# Altium project Battery bank.PrjPcb (part 1 of 2)
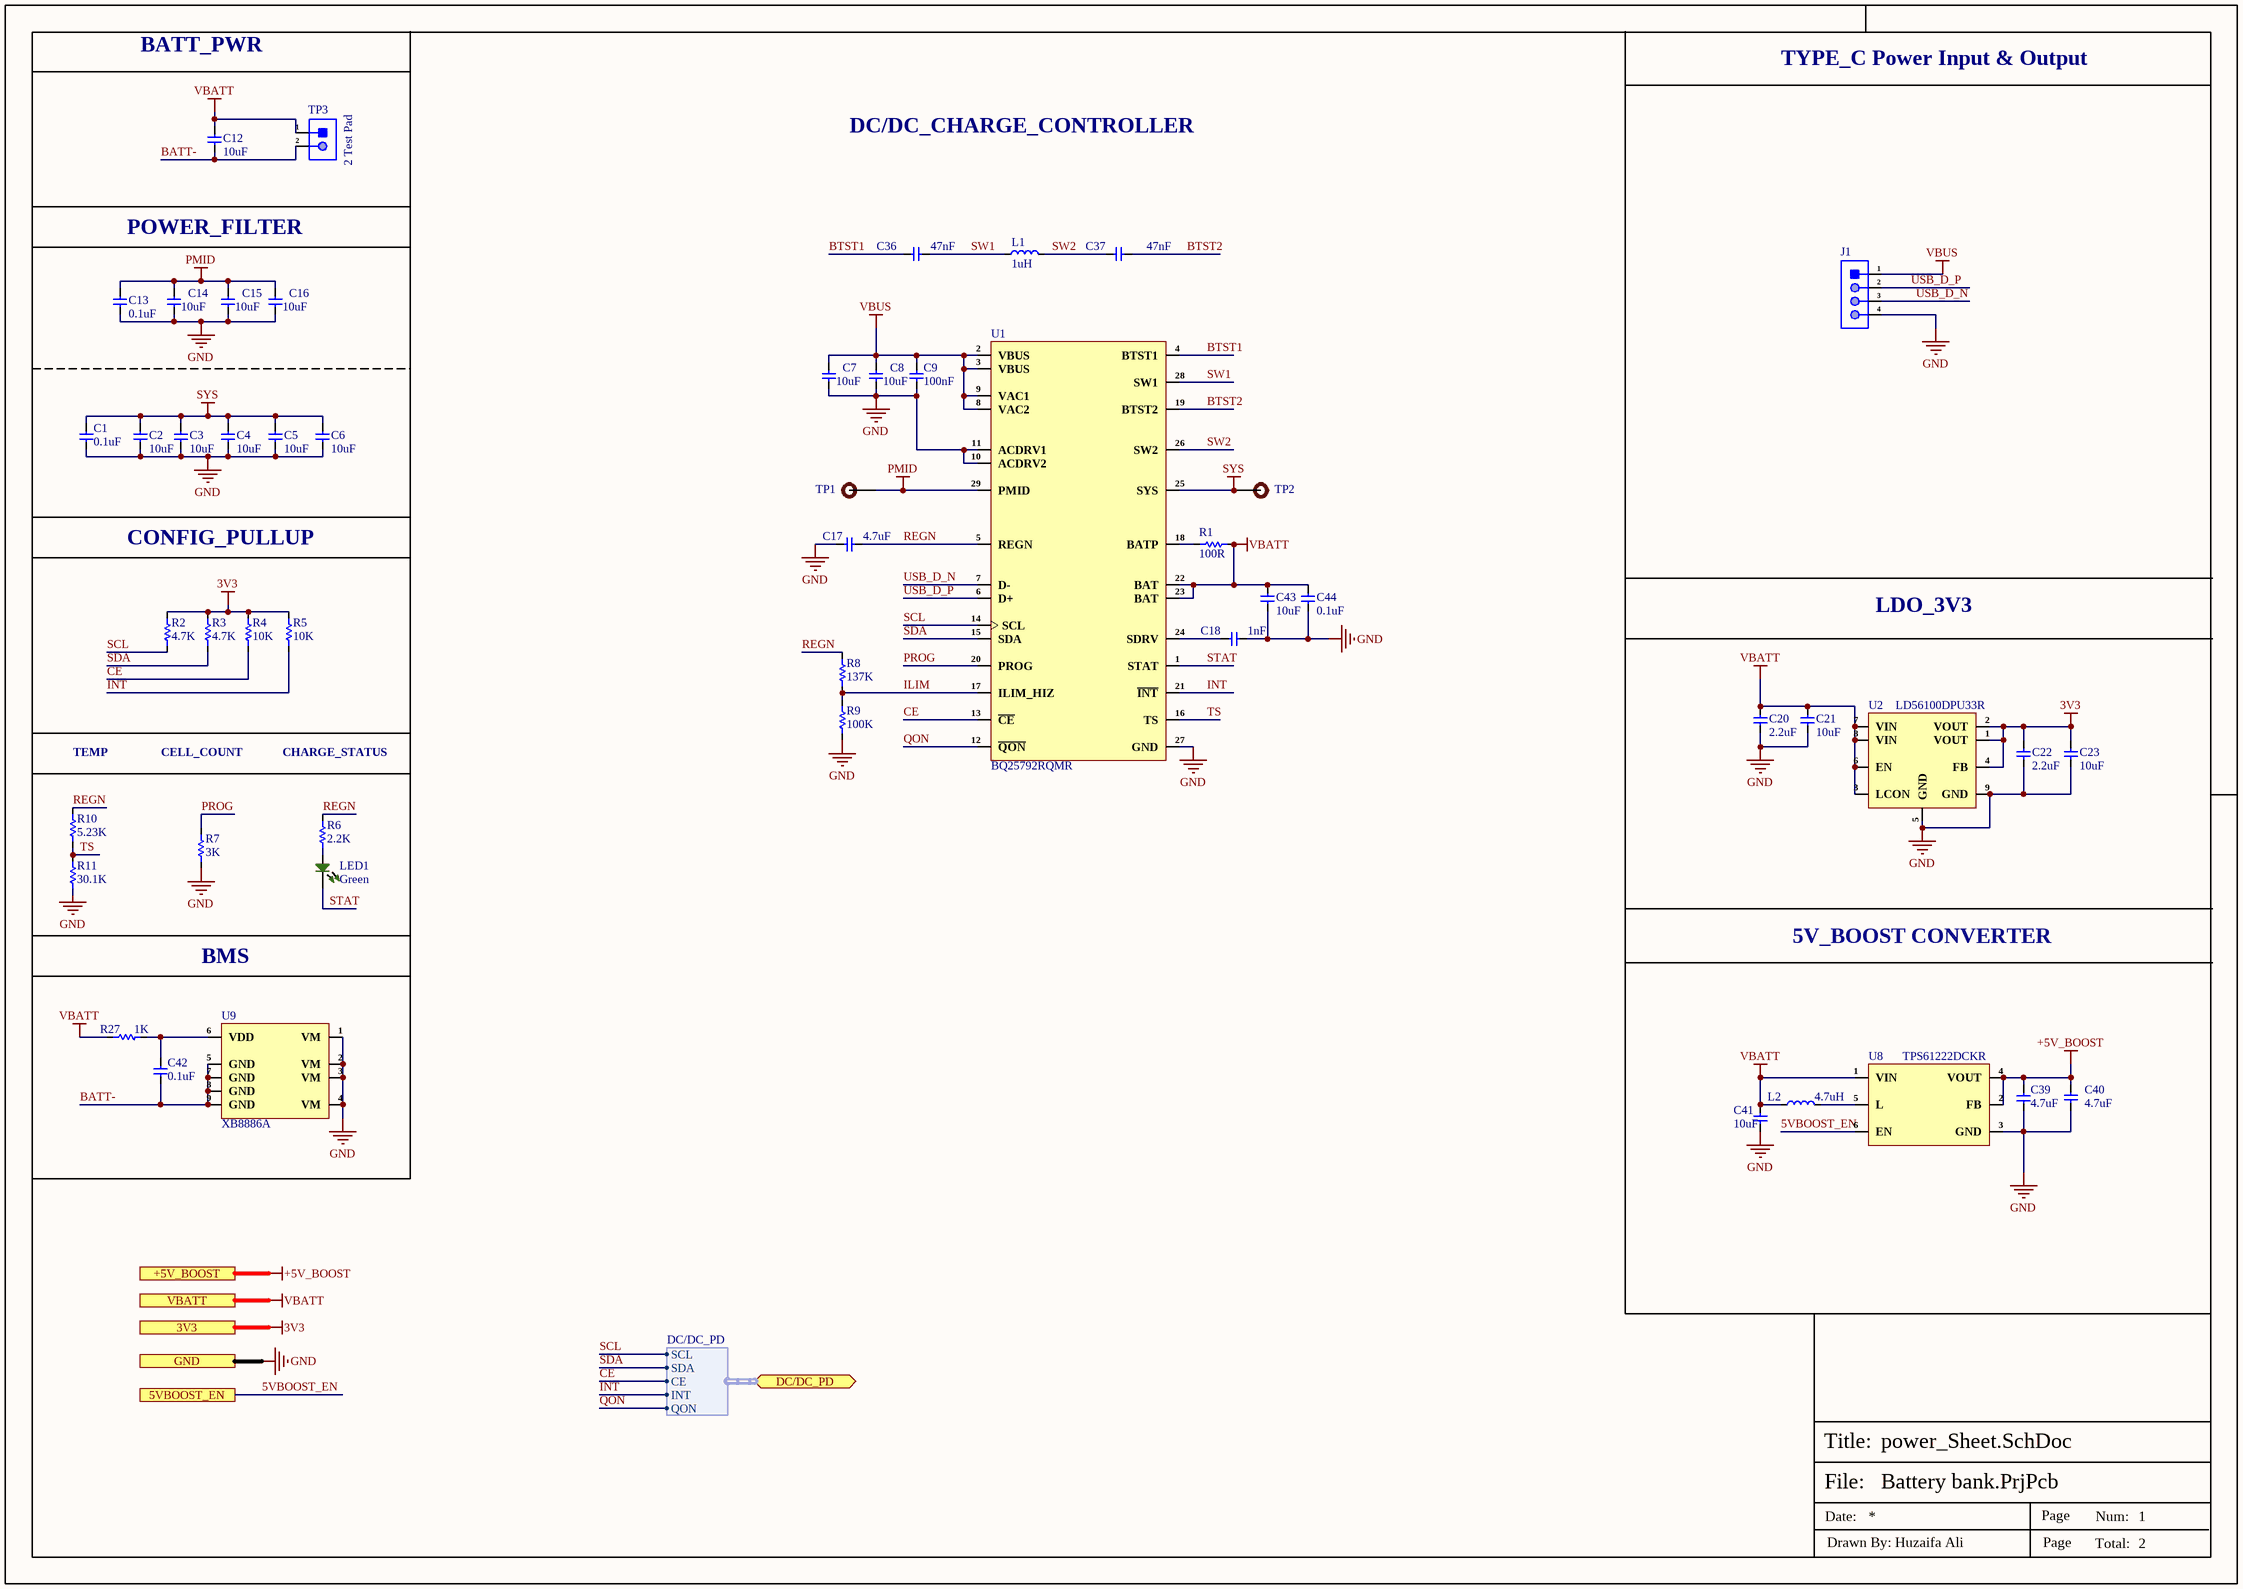
[diagram p0: power_Sheet.SchDoc]
2 sheets, 96 parts. Net scope: flat (ports and power ports of the same name join across sheets).
Board file: Battery Bank_PCB.PcbDoc
Sheets:
  power_Sheet.SchDoc
  Controller_Sheet.SchDoc

## Sheet power_Sheet.SchDoc
size 420 x 297 mm; SheetNumber: 1; SheetTotal: 2

### Parts
C1  0.1uF  [CAP-0201]
C2  10uF  [Cap-0402]
C3  10uF  [Cap-0402]
C4  10uF  [Cap-0402]
C5  10uF  [Cap-0402]
C6  10uF  [Cap-0402]
C7  10uF  [CAP-0603]
C8  10uF  [CAP-0603]
C9  100nF  [cap-0402]
C12  10uF  [Cap-0402]
C13  0.1uF  [CAP-0201]
C14  10uF  [CAP-0603]
C15  10uF  [CAP-0603]
C16  10uF  [CAP-0603]
C17  4.7uF  [Cap-0402]
C18  1nF  [Cap-0402]
C20  2.2uF  [CAP-0201]
C21  10uF  [Cap-0402]
C22  2.2uF  [CAP-0201]
C23  10uF  [Cap-0402]
C36  47nF  [Cap-0402]
C37  47nF  [Cap-0402]
C39  4.7uF  [Cap-0402]
C40  4.7uF  [Cap-0402]
C41  10uF  [Cap-0402]
C42  0.1uF  [CAP-0201]
C43  10uF  [Cap-0402]
C44  0.1uF  [CAP-0201]
J1  4 Pin SMD Wire Connector  [4 Pin SMD Wire CON.]  (value not drawn)  (no BOM)
L1  1uH  [XFL4020-102MEC]
L2  4.7uH  [SLO252012F4R7MTT]
LED1  Green  [LED-0402]
R1  100R  [Res-0402]
R2  4.7K  [Res-0201]
R3  4.7K  [Res-0201]
R4  10K  [Res-0201]
R5  10K  [Res-0201]
R6  2.2K  [Res-0402]
R7  3K  [Res-0402]
R8  137K  [Res-0402]
R9  100K  [Res-0402]
R10  5.23K  [Res-0402]
R11  30.1K  [Res-0402]
R27  1K  [Res-0201]
TP1  TEST POINT 0.5mm Dia  [Test-point - 0.5mm]  (value not drawn)  (no BOM)
TP2  TEST POINT 0.5mm Dia  [Test-point - 0.5mm]  (value not drawn)  (no BOM)
TP3  2 Test Pad  [2 Test Pad]  (no BOM)
U1  BQ25792RQMR  [29-VQFN-HR (4x4)]
U2  LD56100DPU33R  [DFN-8(1.2x1.6)]
U8  TPS61222DCKR  [SC-70-6]
U9  XB8886A  [8-SO-EP_]

### Ports
3V3, 5VBOOST_EN, +5V_BOOST, DC/DC_PD (bidir, harness DC/DC_PD), GND, VBATT

### Harnesses
DC/DC_PD: SCL, SDA, CE, INT, QON

### Nets
3V3: C22.2 C23.2 R2.2 R3.2 R4.1 R5.1 U2.1(VOUT) U2.2(VOUT) U2.4(FB) ; port 3V3
+5V_BOOST: C39.2 C40.1 U8.2(FB) U8.4(VOUT) ; port +5V_BOOST
GND: C1.1 C2.1 C3.1 C4.1 C5.1 C6.1 C7.1 C8.1 C9.1 C13.1 C14.1 C15.1 C16.1 C17.2 C18.1 C20.1 C21.1 C22.1 C23.1 C39.1 C40.2 C41.1 C43.1 C44.1 J1.4 R7.1 R9.1 R11.1 U1.10(ACDRV2) U1.11(ACDRV1) U1.27(GND) U2.5(GND) U2.9(GND) U8.3(GND) U9.1(VM) U9.2(VM) U9.3(VM) U9.4(VM) ; port GND
PMID: C13.2 C14.2 C15.2 C16.2 TP1.1 U1.29(PMID)
SYS: C1.2 C2.2 C3.2 C4.2 C5.2 C6.2 TP2.1 U1.25(SYS)
VBATT: C12.2 C20.2 C21.2 C41.2 C43.2 C44.2 L2.1 R1.2 R27.1 TP3.1 U1.22(BAT) U1.23(BAT) U2.3(LCON) U2.6(EN) U2.7(VIN) U2.8(VIN) U8.1(VIN) ; port VBATT
VBUS: C7.2 C8.2 C9.2 J1.1 U1.2(VBUS) U1.3(VBUS) U1.8(VAC2) U1.9(VAC1)
5VBOOST_EN: U8.6(EN) ; port 5VBOOST_EN
BATT-: C12.1 C42.1 TP3.2 U9.5(GND) U9.7(GND) U9.8(GND) U9.9(GND)
BTST1: C36.1 U1.4(BTST1)
BTST2: C37.2 U1.19(BTST2)
CE: R4.2 U1.13(~{CE}) ; port DC/DC_PD.CE
ILIM: R8.1 R9.2 U1.17(ILIM_HIZ)
INT: R5.2 U1.21(~{INT}) ; port DC/DC_PD.INT
PROG: R7.2 U1.20(PROG)
QON: U1.12(~{QON}) ; port DC/DC_PD.QON
REGN: C17.1 R6.2 R8.2 R10.1 U1.5(REGN)
SCL: R2.1 U1.14(SCL) ; port DC/DC_PD.SCL
SDA: R3.1 U1.15(SDA) ; port DC/DC_PD.SDA
STAT: LED1.2 U1.1(STAT)
SW1: C36.2 L1.1 U1.28(SW1)
SW2: C37.1 L1.2 U1.26(SW2)
TS: R10.2 R11.2 U1.16(TS)
USB_D_N: J1.3 U1.7(D-)
USB_D_P: J1.2 U1.6(D+)
NetC18_2: C18.2 U1.24(SDRV)
NetC42_2: C42.2 R27.2 U9.6(VDD)
NetL2_2: L2.2 U8.5(L)
NetLED1_1: LED1.1 R6.1
NetR1_1: R1.1 U1.18(BATP)

### Notes on the sheet
- BATT_PWR
- TYPE_C Power Input & Output
- DC/DC_CHARGE_CONTROLLER
- POWER_FILTER
- CONFIG_PULLUP
- LDO_3V3
- TEMP
- CELL_COUNT
- CHARGE_STATUS
- 5V_BOOST CONVERTER
- BMS
- File:
- Title:
- Date:
- Page
- Num:
- Total:
- Drawn By: Huzaifa Ali

### Library data of the parts
C1 C13 C42 C44 = GRM033C81E104KE14D: CAP CER 0.1UF 25V X6S 0201; Manufacturer: Murata; Capacitance: 100nF; Tolerance: 10%; Supplier 1: Digi-Key; Manufacturer Part Number: GRM033C81E104KE14D; RoHS: Yes; Category: Ceramic Capacitors; Stock 1: 91; Pricing 1: 1=0.10000, 10=0.05100, 50=0.02780, 100=0.02260, 500=0.01616, 1000=0.01270, 2500=0.01155, 5000=0.01063 (USD); Mount: Surface Mount; Case/Package: 0201; Case Code (Metric): 0603; Case Code (Imperial): 0201; Weight: 1.2E-05oz; Min Operating Temperature: -55°C; Max Operating Temperature: 105°C; Packaging: Tape and Reel; Voltage Rating: 25V; Dielectric: X6S; Termination: SMD/SMT; Voltage Rating (DC): 25V; Package Quantity: 15000; Length: 0.024inch; Width: 0.3mm; Height: 0.3mm; Thickness: 0.013inch; RoHS Compliant: Yes; ComponentLink1URL: http://www.mouser.com/ds/2/281/c02e-2905.pdf?src-supplier=Mouser; ComponentLink1Description: http://www.mouser.com/ds/2/281/c02e-2905.pdf?src-supplier=Mouser; ComponentLink2URL: http://www.farnell.com/datasheets/2722733.pdf?src-supplier=Farnell; ComponentLink2Description: http://www.farnell.com/datasheets/2722733.pdf?src-supplier=Farnell; ComponentLink3URL: http://search.murata.co.jp/Ceramy/image/img/A01X/G101/ENG/GRM033C81E104KE14-01.pdf?src-supplier=Digi-Key; ComponentLink3Description: http://search.murata.co.jp/Ceramy/image/img/A01X/G101/ENG/GRM033C81E104KE14-01.pdf?src-supplier=Digi-Key; Supplier Part Number 1: 490-10403-1-ND
C2-C6 C21 C23 C41 C43 = CC0402MRX5R6BB106: CAP CER 10UF 10V X5R 0402; Manufacturer: Yageo; Tolerance: 20%; Item Type: Capacitor; Supplier 1: Future Electronics; Manufacturer Part Number: CC0402MRX5R6BB106; RoHS: Yes; Category: Ceramic Capacitors; Stock 1: 80000; Pricing 1: 10000=0.02650, 20000=0.02590, 30000=0.02550, 40000=0.02530, 50000=0.02450 (USD); Mount: Surface Mount; Case/Package: 0402; Case Code (Imperial): 0402; Case Code (Metric): 1005; Min Operating Temperature: -55°C; Max Operating Temperature: 85°C; Packaging: Tape and Reel; Capacitance: 10uF; Voltage Rating: 10V; RoHS Compliant: Yes; ComponentLink1URL: http://www.yageo.com/documents/recent/UPY-GPHC_X5R_4V-to-50V_25.pdf?src-supplier=Digi-Key; ComponentLink1Description: http://www.yageo.com/documents/recent/UPY-GPHC_X5R_4V-to-50V_25.pdf?src-supplier=Digi-Key; Supplier Part Number 1: 6097631; LCSC Part Number: C962143
C7 C8 C14-C16 = TMK107BBJ106MA-T: CAP CER 10UF 25V X5R 0603; Manufacturer: Taiyo Yuden; Tolerance: 20%; Supplier 1: Digi-Key; Manufacturer Part Number: TMK107BBJ106MA-T; Stock 1: 85333; Pricing 1: 1=0.46, 10=0.32, 50=0.2238, 100=0.1918, 500=0.14386, 1000=0.12149 (USD); Mount: Surface Mount; Case/Package: 0603; Case Code (Imperial): 0603; Case Code (Metric): 1608; Min Operating Temperature: -55°C; Max Operating Temperature: 85°C; Packaging: Tape and Reel; Capacitance: 10uF; Voltage Rating: 25V; Lead Free: Lead Free; RoHS Compliant: Yes; ComponentLink1URL: http://ds.yuden.co.jp/TYCOMPAS/ut/detail.do?productNo=TMK107BBJ106MA-T&fileName=TMK107BBJ106MA-T_SS&mode=specSheetDownload&src-supplier=Digi-Key; ComponentLink1Description: http://ds.yuden.co.jp/TYCOMPAS/ut/detail.do?productNo=TMK107BBJ106MA-T&fileName=TMK107BBJ106MA-T_SS&mode=specSheetDownload&src-supplier=Digi-Key; Supplier Part Number 1: 587-6023-1-ND; LCSC Part Number: C386081
C9 = C1005X7R1H104KT000F: CAP CER 0.1UF 50V X7R 0402; Manufacturer: TDK; Tolerance: 10%; Voltage: 25V; Item Type: Capacitor; Supplier 1: Avnet; Manufacturer Part Number: C1005X7R1H104KT000F; RoHS: No; Category: Ceramic Capacitors; Dielectric: X7R; Supplier Part Number 1: C1005X7R1H104KT000F; LCSC Part Number: C361198; ComponentLink1Description: LCSC; ComponentLink1URL: https://www.lcsc.com/product-detail/Multilayer-Ceramic-Capacitors-MLCC-SMD-SMT_TDK-C1005X7R1H104KT000F_C361198.html
C12 = CL05A106MP5NUNC: CAP CER 10UF 10V X5R 0402; Manufacturer: Samsung; Tolerance: 20%; Item Type: Capacitor; Supplier 1: Avnet; Manufacturer Part Number: CL05A106MP5NUNC; RoHS: Yes; Category: Ceramic Capacitors; Stock 1: 1729850; Pricing 1: 10000=0.02537 (USD); Mount: Surface Mount; Case/Package: 0402; Case Code (Metric): 1005; Case Code (Imperial): 0402; Contact Plating: Tin; Min Operating Temperature: -55°C; Max Operating Temperature: 85°C; Package Quantity: 1; Packaging: Tape and Reel; Capacitance: 10uF; Voltage Rating: 10V; Dielectric: X5R; Termination: Wraparound; Series: CL; Construction: Flat; Length: 1mm; Width: 0.02inch; Thickness: 0.028inch; Depth: 0.5mm; Radiation Hardening: No; Lead Free: Lead Free; RoHS Compliant: Yes; ComponentLink1URL: https://datasheet.ciiva.com/25721/cl05a106mp5nunc-25721584.pdf?src-supplier=Digi-Key; ComponentLink1Description: https://datasheet.ciiva.com/25721/cl05a106mp5nunc-25721584.pdf?src-supplier=Digi-Key; ComponentLink2URL: https://datasheet.ciiva.com/26838/getdatasheetpartid-745310-26838170.pdf?src-supplier=Verical; ComponentLink2Description: https://datasheet.ciiva.com/26838/getdatasheetpartid-745310-26838170.pdf?src-supplier=Verical; Supplier Part Number 1: CL05A106MP5NUNC; LCSC Part Number: C315248
C17 C39 C40 = CL05A475MO5NUNC: CAP CER 4.7UF 16V X5R 0402; Manufacturer: Samsung; Material: 4241ConductorMaterial; Tolerance: 20%; Supplier 1: Avnet; Manufacturer Part Number: CL05A475MO5NUNC; RoHS: Yes; Category: Ceramic Capacitors; Stock 1: 50000; Pricing 1: 10000=0.09712 (USD); Mount: Surface Mount; Case/Package: 0402; Case Code (Metric): 1005; Case Code (Imperial): 0402; Min Operating Temperature: -55°C; Max Operating Temperature: 85°C; Packaging: Cut Tape; Capacitance: 4.7uF; Voltage Rating: 16V; Series: CL; Voltage Rating (DC): 16V; Length: 0.039inch; Width: 0.02inch; Height: 550um; Thickness: 0.022inch; RoHS Compliant: Yes; ComponentLink1URL: http://www.farnell.com/datasheets/2710653.pdf?src-supplier=Farnell; ComponentLink1Description: http://www.farnell.com/datasheets/2710653.pdf?src-supplier=Farnell; ComponentLink2URL: http://www.samsungsem.com/kr/support/product-search/mlcc/CL05A475MO5NUNC.jsp?src-supplier=Digikey; ComponentLink2Description: http://www.samsungsem.com/kr/support/product-search/mlcc/CL05A475MO5NUNC.jsp?src-supplier=Digikey; ComponentLink3URL: http://www.farnell.com/datasheets/2710653.pdf?src-supplier=Element14; ComponentLink3Description: http://www.farnell.com/datasheets/2710653.pdf?src-supplier=Element14; ComponentLink4URL: https://datasheet.octopart.com/CL05A475MO5NUNC-Samsung-Electro-Mechanics-datasheet-123102911.pdf?src-supplier=Future+Electronics; ComponentLink4Description: https://datasheet.octopart.com/CL05A475MO5NUNC-Samsung-Electro-Mechanics-datasheet-123102911.pdf?src-supplier=Future+Electronics; ComponentLink5URL: http://www.farnell.com/datasheets/2710653.pdf?src-supplier=Newark; ComponentLink5Description: http://www.farnell.com/datasheets/2710653.pdf?src-supplier=Newark; Supplier Part Number 1: CL05A475MO5NUNC
C18 = VJ0402Y103JXXAC: CAP CER 10000PF 25V X7R 0402; Manufacturer: Vishay Vitramon; Capacitance: 10nF; Tolerance: 5%; Item Type: Capacitor; Supplier 1: Digi-Key; Manufacturer Part Number: VJ0402Y103JXXAC; Stock 1: 65000; Pricing 1: 5000=0.08639, 10000=0.08131, 15000=0.07877, 25000=0.07623, 50000=0.07115 (USD); Mount: Surface Mount; Case/Package: 0402; Number of Pins: 2; Case Code (Imperial): 0402; Case Code (Metric): 1005; Min Operating Temperature: -55°C; Max Operating Temperature: 150°C; Dielectric: X7R; Packaging: Tape and Reel; Voltage Rating: 25V; Voltage Rating (DC): 25V; Termination: SMD/SMT; Series: VJ COMM; Construction: Flat; Length: 1mm; Width: 0.5mm; Height: 0.6mm; Depth: 0.5mm; Radiation Hardening: No; Lead Free: Lead Free; RoHS Compliant: Yes; ComponentLink1URL: http://www.vishay.com/docs/45199/vjcommercialseries.pdf?src-supplier=Digi-Key; ComponentLink1Description: http://www.vishay.com/docs/45199/vjcommercialseries.pdf?src-supplier=Digi-Key; ComponentLink2URL: http://www.mouser.com/ds/2/427/vjcommercialseries-222796.pdf?src-supplier=Mouser; ComponentLink2Description: http://www.mouser.com/ds/2/427/vjcommercialseries-222796.pdf?src-supplier=Mouser; ComponentLink3URL: http://www.vishay.com/docs/45199/commseri.pdf?src-supplier=Avnet; ComponentLink3Description: http://www.vishay.com/docs/45199/commseri.pdf?src-supplier=Avnet; ComponentLink4URL: http://components.arrow.com/part/dataview/3604811S5190749N4403?src-supplier=Arrow+Electronics; ComponentLink4Description: http://components.arrow.com/part/dataview/3604811S5190749N4403?src-supplier=Arrow+Electronics; ComponentLink5URL: http://components.arrow.com/part/dataview/0323_01555941?src-supplier=Arrow+Europe; ComponentLink5Description: http://components.arrow.com/part/dataview/0323_01555941?src-supplier=Arrow+Europe; ComponentLink6URL: http://www.onlinecomponents.com/datasheet/vj0402y103jxxac.aspx?p=35767938&src-supplier=Onlinecomponents.com; ComponentLink6Description: http://www.onlinecomponents.com/datasheet/vj0402y103jxxac.aspx?p=35767938&src-supplier=Onlinecomponents.com; ComponentLink7URL: http://www.vishay.com/docs/45040/autospec.pdf?src-supplier=Future+Electronics; ComponentLink7Description: http://www.vishay.com/docs/45040/autospec.pdf?src-supplier=Future+Electronics; ComponentLink8URL: http://www.vishay.com/docs/45199/commseri.pdf?src-supplier=Avnet+Europe; ComponentLink8Description: http://www.vishay.com/docs/45199/commseri.pdf?src-supplier=Avnet+Europe; Supplier Part Number 1: 720-1897-2-ND; LCSC Part Number: C2175851
C20 C22 = CC0201MRX5R6BB225: CAP CER 2.2UF 10V X5R 0201; Manufacturer: Yageo; Tolerance: 20%; Item Type: Capacitor; Supplier: Mouser; Supplier Part Number: 603-CC0201MRX56BB225; Manufacturer Part Number: CC0201MRX5R6BB225; RoHS: Yes; Category: Ceramic Capacitors; Stock: 25553; Pricing: 1=0.43, 10=0.294, 50=0.294, 100=0.176, 1000=0.112, 10000=0.091 (USD); Mounting Technology: Surface Mount; Case/Package: 0201; Min Operating Temperature: -55°C; Max Operating Temperature: 85°C; Packaging: Tape and Reel; Value: 2.2uF; Voltage Rating: 10V; Series: CC; RoHS Compliant: Yes; ComponentLink1URL: https://www.yageo.com/upload/media/product/productsearch/datasheet/mlcc/UPY-GPHC_X5R_4V-to-50V_26.pdf?src-supplier=Digi-Key; ComponentLink1Description: https://www.yageo.com/upload/media/product/productsearch/datasheet/mlcc/UPY-GPHC_X5R_4V-to-50V_26.pdf?src-supplier=Digi-Key; LCSC Part Number: C2186869
C36 C37 = CC0402KRX7R9BB473: CAP CER 0.047UF 50V X7R 0402; Manufacturer: Yageo; Material: 4241ConductorMaterial; Tolerance: 10%; Temperature Coefficient: 30ppm/°C; Dielectric: 1511DielectricType; Item Type: Capacitor; Supplier: Future Electronics; Supplier Part Number: 2095687; Manufacturer Part Number: CC0402KRX7R9BB473; RoHS: Yes; Category: Ceramic Capacitors; Stock: 1130000; Pricing: 10000=0.0044, 40000=0.0042, 100000=0.004, 150000=0.0041, 250000=0.0039, 400000=0.0037, 500000=0.0038 (USD); Mounting Technology: Surface Mount; Case/Package: 0402; Case Code (Imperial): 0402; Case Code (Metric): 1005; Min Operating Temperature: -55°C; Max Operating Temperature: 125°C; Packaging: Tape and Reel; Value: 47nF; Voltage Rating: 50V; Series: CC; Voltage Rating (DC): 50V; Length: 0.039inch; Width: 0.02inch; Height: 550um; Thickness: 0.022inch; RoHS Compliant: Yes; Halogen Free: 5694HalogenFree; Lead Free: 5697LeadFree; ComponentLink1URL: https://datasheet.octopart.com/CC0402KRX7R9BB473-Yageo-datasheet-166511530.pdf?src-supplier=Future+Electronics; ComponentLink1Description: https://datasheet.octopart.com/CC0402KRX7R9BB473-Yageo-datasheet-166511530.pdf?src-supplier=Future+Electronics; ComponentLink2URL: http://www.yageo.com/documents/recent/UPY-GPHC_X7R_6.3V-to-50V_18.pdf?src-supplier=Digikey; ComponentLink2Description: http://www.yageo.com/documents/recent/UPY-GPHC_X7R_6.3V-to-50V_18.pdf?src-supplier=Digikey; ComponentLink3URL: https://datasheet.octopart.com/CC0402KRX7R9BB473-Yageo-datasheet-140260305.pdf?src-supplier=Newark; ComponentLink3Description: https://datasheet.octopart.com/CC0402KRX7R9BB473-Yageo-datasheet-140260305.pdf?src-supplier=Newark; LCSC Part Number: C272875
J1 = 4 Pin SMD Wire Connector: Wire Connecting Pads; Item Type: SMD Pads; Manufacturer Part Number: 4 Pin SMD Wire Connector
L1 = XFL4020-102MEC: FIXED IND 1UH 11A 11.9MOHM SM; Manufacturer: Coilcraft; Core Material: Composite; Self Resonant Frequency: 64MHz; Tolerance: 20%; Shielding: Shielded; Test Frequency: 100kHz; Saturation Current: 4.5A; ESR: 11.9mR; Item Type: Inductor; Supplier: Mouser; Supplier Part Number: 994-XFL4020-102MEC; Manufacturer Part Number: XFL4020-102MEC; RoHS: Yes; Category: Fixed Inductors; Stock: 12821; Pricing: 1=2.68, 10=2.68, 50=2.68, 100=2.68, 1000=1.01, 10000=1.01 (USD); Mounting Technology: Surface Mount; Case/Package: SMD/SMT; Min Operating Temperature: -40°C; Max Operating Temperature: 125°C; Packaging: Tape and Reel; Value: 1uH; Max DC Current: 11A; Termination: SMD/SMT; Series: XFL4020; Inductance Tolerance: 20%; RMS Current (Irms): 11A; Length: 4.3mm; Width: 4.3mm; Height: 2.1mm; Reach SVHC Compliant: No; Lead Free: Contains Lead; RoHS Compliant: Yes; ComponentLink1URL: https://datasheet.ciiva.com/22679/1682010-22679273.pdf?src-supplier=Element14; ComponentLink1Description: https://datasheet.ciiva.com/22679/1682010-22679273.pdf?src-supplier=Element14; ComponentLink2URL: https://datasheet.ciiva.com/22679/1682010-22679274.pdf?src-supplier=Element14; ComponentLink2Description: https://datasheet.ciiva.com/22679/1682010-22679274.pdf?src-supplier=Element14; ComponentLink3URL: https://datasheet.ciiva.com/13168/xfl4020-13168079.pdf?src-supplier=Mouser; ComponentLink3Description: https://datasheet.ciiva.com/13168/xfl4020-13168079.pdf?src-supplier=Mouser; LCSC Part Number: C5355380
L2 = SLO252012F4R7MTT: 1.55A 4.7uH ±20% SMD Power Inductors ROHS; Manufacturer: Sunltech Tech; Manufacturer Part Number: SLO252012F4R7MTT; Package: SMD; LCSC Part Number: C275675; Item Type: Inductor; ComponentLink1Description: LCSC; ComponentLink1URL: https://www.lcsc.com/product-detail/Power-Inductors_Sunltech-Tech-SLO252012F4R7MTT_C275675.html
LED1 = 16-213/GHC-YR1S1/3T: Green 520~535nm 0402 Light Emitting Diodes (LED) RoHS; Manufacturer: Everlight Elec; Luminous Intensity (IF=20mA): 112~285mcd; Package: 0402; Illumination Color: Green; Dominant Wavelength / Coordinate rank: 520~535nm; Mounting Type: Surface Mount; Manufacturer Part Number: 16-213/GHC-YR1S1/3T; ComponentLink1Description: LCSC; ComponentLink1URL: https://www.lcsc.com/product-detail/Light-Emitting-Diodes-LED_Everlight-Elec-16-213-GHC-YR1S1-3T_C74338.html; LCSC Part Number: C74338; Item Type: LED
R1 = RC0402FR-07100RL: RES 100 OHM 1% 1/16W 0402; Manufacturer: Yageo; Power Rating: 62.5mW; Voltage Rating: 50V; Temperature Coefficient: 100ppm/°C; Max Power Dissipation: 63mW; Item Type: Resistor; Supplier 1: Mouser; Manufacturer Part Number: RC0402FR-07100RL; RoHS: Yes; Category: Chip SMD Resistors; Stock 1: 699545; Pricing 1: 1=0.10000, 10=0.01200, 50=0.01200, 100=0.00500, 1000=0.00300, 2500=0.00200, 10000=0.00100 (USD); Case/Package: 0402; Number of Pins: 2; Case Code (Imperial): 0402; Case Code (Metric): 1005; Size Code: 0402; Min Operating Temperature: -55°C; Max Operating Temperature: 155°C; Tolerance: 1%; Voltage Rating (DC): 50V; Resistance: 100R; Packaging: Tape and Reel; Termination: SMD/SMT; Resistor Type: Thick Film; Features: Moisture Resistant; Series: RC; Number of Terminations: 2; Resistance Tolerance: 1%; Construction: Rectangular; Technology: THICK FILM; Length: 1mm; Width: 0.5mm; Height: 0.32mm; Depth: 0.5mm; RoHS Compliant: Yes; REACH SVHC: No SVHC; Military Standard: Not; Lead Free: Lead Free; ComponentLink1URL: https://datasheet.ciiva.com/11808/0900766b80c66297-11808765.pdf?src-supplier=RSComponents; ComponentLink1Description: https://datasheet.ciiva.com/11808/0900766b80c66297-11808765.pdf?src-supplier=RSComponents; ComponentLink2URL: https://datasheet.ciiva.com/7849/1784430-7849810.pdf?src-supplier=Element14; ComponentLink2Description: https://datasheet.ciiva.com/7849/1784430-7849810.pdf?src-supplier=Element14; ComponentLink3URL: https://datasheet.ciiva.com/28367/1018594-28367226.pdf?src-supplier=Element14; ComponentLink3Description: https://datasheet.ciiva.com/28367/1018594-28367226.pdf?src-supplier=Element14; ComponentLink4URL: https://datasheet.ciiva.com/22747/1018594-22747511.pdf?src-supplier=Element14; ComponentLink4Description: https://datasheet.ciiva.com/22747/1018594-22747511.pdf?src-supplier=Element14; ComponentLink5URL: https://datasheet.ciiva.com/12667/pyu-rc0402-51-rohs-l-6-r-12667957.pdf?src-supplier=Mouser; ComponentLink5Description: https://datasheet.ciiva.com/12667/pyu-rc0402-51-rohs-l-6-r-12667957.pdf?src-supplier=Mouser; ComponentLink6URL: https://datasheet.ciiva.com/15189/getdatasheetpartid-329466-15189335.pdf?src-supplier=Verical; ComponentLink6Description: https://datasheet.ciiva.com/15189/getdatasheetpartid-329466-15189335.pdf?src-supplier=Verical; ComponentLink7URL: https://datasheet.ciiva.com/16740/pyu-rc0402-51-rohs-l-6-r-16740566.pdf?src-supplier=Future+Electronics; ComponentLink7Description: https://datasheet.ciiva.com/16740/pyu-rc0402-51-rohs-l-6-r-16740566.pdf?src-supplier=Future+Electronics; Supplier Part Number 1: 603-RC0402FR-07100RL; LCSC Part Number: C106232
R2 R3 = RC0201FR-074K7L: RES 4.7K OHM 1% 1/20W 0201; Manufacturer: Yageo; Item Type: Resistor; Supplier: Future Electronics; Supplier Part Number: 7537285; Manufacturer Part Number: RC0201FR-074K7L; RoHS: Yes; Category: Chip SMD Resistors; Stock: 1610000; Pricing: 10000=0.0014, 50000=0.0013, 250000=0.0013, 750000=0.0012, 2000000=0.0011 (USD); ComponentLink1URL: https://datasheet.ciiva.com/2493/pyu-r-int-thick-7-2493811.pdf?src-supplier=Digi-Key; ComponentLink1Description: https://datasheet.ciiva.com/2493/pyu-r-int-thick-7-2493811.pdf?src-supplier=Digi-Key; ComponentLink2URL: https://datasheet.ciiva.com/2493/pyu-r-int-thick-7-2493812.pdf?src-supplier=Digi-Key; ComponentLink2Description: https://datasheet.ciiva.com/2493/pyu-r-int-thick-7-2493812.pdf?src-supplier=Digi-Key; ComponentLink3URL: https://datasheet.ciiva.com/2493/pyu-r-int-thick-7-2493813.pdf?src-supplier=Digi-Key; ComponentLink3Description: https://datasheet.ciiva.com/2493/pyu-r-int-thick-7-2493813.pdf?src-supplier=Digi-Key; ComponentLink4URL: https://datasheet.ciiva.com/8892/pyu-rc0201-51-rohs-l-8-8892942.pdf?src-supplier=Avnet; ComponentLink4Description: https://datasheet.ciiva.com/8892/pyu-rc0201-51-rohs-l-8-8892942.pdf?src-supplier=Avnet; ComponentLink5URL: https://datasheet.ciiva.com/7672/1563626-7672233.pdf?src-supplier=Element14; ComponentLink5Description: https://datasheet.ciiva.com/7672/1563626-7672233.pdf?src-supplier=Element14; LCSC Part Number: C138135
R4 R5 = RC0201FR-0710KL: RES SMD 10K OHM 1% 1/20W 0201; Manufacturer: Yageo; Item Type: Resistor; Manufacturer Part Number: RC0201FR-0710KL; Package: 0201; ComponentLink7Description: LCSC; ComponentLink7URL: https://www.lcsc.com/product-detail/Chip-Resistor-Surface-Mount_YAGEO-RC0201FR-0710KL_C106225.html; LCSC Part Number: C106225
R6 = RC0402FR-072K2L: RES SMD 2.2K OHM 1% 1/16W 0402; Manufacturer: Yageo; Resistance: 2.2kR; Power Rating: 63mW; Voltage Rating: 50V; Temperature Coefficient: 100ppm/°C; Supplier 1: Digi-Key; Manufacturer Part Number: RC0402FR-072K2L; Stock 1: 966157; Pricing 1: 1=0.1, 10=0.016, 100=0.0066, 1000=0.00299, 2500=0.00259, 5000=0.00214 (USD); Case/Package: 0402; Case Code (Imperial): 0402; Case Code (Metric): 1005; Weight: 2.3E-05oz; Size Code: 0402; Min Operating Temperature: -55°C; Max Operating Temperature: 155°C; Resistor Type: Thick Film; Packaging: Tape and Reel; Tolerance: 1%; Termination: SMD/SMT; Features: Moisture Resistant; Series: RC; Max Power Dissipation: 63mW; Number of Terminations: 2; Resistance Tolerance: 1%; Construction: Rectangular; Technology: THICK FILM; Length: 1mm; Width: 0.5mm; Height: 0.35mm; Depth: 0.5mm; RoHS Compliant: Yes; REACH SVHC: Unknown; Military Standard: Not; Lead Free: Lead Free; ComponentLink1URL: http://www.farnell.com/datasheets/2167052.pdf?src-supplier=Element14; ComponentLink1Description: http://www.farnell.com/datasheets/2167052.pdf?src-supplier=Element14; ComponentLink2URL: http://www.yageo.com/documents/recent/PYu-RC_Group_51_RoHS_L_9.pdf?src-supplier=Mouser; ComponentLink2Description: http://www.yageo.com/documents/recent/PYu-RC_Group_51_RoHS_L_9.pdf?src-supplier=Mouser; ComponentLink3URL: http://documents.rs-components.com/techlib://itc_doclist_GB.htm?stockno=6186532&src-supplier=RSComponents; ComponentLink3Description: http://documents.rs-components.com/techlib://itc_doclist_GB.htm?stockno=6186532&src-supplier=RSComponents; ComponentLink4URL: http://www.yageo.com/documents/recent/PYu-RC0402_51_RoHS_L_6_r.pdf?src-supplier=Future+Electronics; ComponentLink4Description: http://www.yageo.com/documents/recent/PYu-RC0402_51_RoHS_L_6_r.pdf?src-supplier=Future+Electronics; Supplier Part Number 1: 311-2.20KLRCT-ND; LCSC Part Number: C114762
R7 = RC0402FR-073KL: RES 3K OHM 1% 1/16W 0402; Manufacturer: Yageo; Value: 3kR; Power Rating: 63mW; Voltage Rating: 50V; Temperature Coefficient: 100ppm/°C; Item Type: Resistor; Supplier: Digikey; Supplier Part Number: 311-3KLRCT-ND; Manufacturer Part Number: RC0402FR-073KL; RoHS: Yes; Category: Chip SMD Resistors; Stock: 7013; Pricing: 1=0.1, 10=0.015, 50=0.0088, 100=0.0073, 500=0.00488, 1000=0.00417, 5000=0.00297 (USD); Case/Package: 0402; Case Code (Metric): 1005; Case Code (Imperial): 0402; Min Operating Temperature: -55°C; Max Operating Temperature: 155°C; Tolerance: 1%; Package Quantity: 1; Packaging: Tape and Reel; Resistor Type: Thick Film; Number of Terminations: 2; Termination: SMD/SMT; Max Power Dissipation: 63mW; Features: Moisture Resistant; Series: RC; Resistance Tolerance: 1%; Construction: Rectangular; Voltage Rating (DC): 50V; Length: 0.039inch; Width: 0.02inch; Height: 0.016inch; Depth: 0.5mm; Military Standard: Not; RoHS Compliant: Yes; Reach SVHC Compliant: Unknown; Lead Free: 5697LeadFree; ComponentLink1URL: https://datasheet.ciiva.com/2553/pyu-r-int-thick-7-2553254.pdf?src-supplier=Digikey; ComponentLink1Description: https://datasheet.ciiva.com/2553/pyu-r-int-thick-7-2553254.pdf?src-supplier=Digikey; ComponentLink2URL: https://datasheet.ciiva.com/7849/1018594-7849992.pdf?src-supplier=Element14; ComponentLink2Description: https://datasheet.ciiva.com/7849/1018594-7849992.pdf?src-supplier=Element14; ComponentLink3URL: https://datasheet.ciiva.com/7849/1018594-7849991.pdf?src-supplier=Element14; ComponentLink3Description: https://datasheet.ciiva.com/7849/1018594-7849991.pdf?src-supplier=Element14; ComponentLink4URL: https://datasheet.ciiva.com/2553/pyu-r-int-thick-7-2553255.pdf?src-supplier=Digikey; ComponentLink4Description: https://datasheet.ciiva.com/2553/pyu-r-int-thick-7-2553255.pdf?src-supplier=Digikey; ComponentLink5URL: https://datasheet.ciiva.com/2553/pyu-r-int-thick-7-2553256.pdf?src-supplier=Digikey; ComponentLink5Description: https://datasheet.ciiva.com/2553/pyu-r-int-thick-7-2553256.pdf?src-supplier=Digikey; ComponentLink6URL: https://datasheet.ciiva.com/12666/pyu-rc0402-51-rohs-l-6-r-12666952.pdf?src-supplier=Mouser; ComponentLink6Description: https://datasheet.ciiva.com/12666/pyu-rc0402-51-rohs-l-6-r-12666952.pdf?src-supplier=Mouser; LCSC Part Number: C137987
R8 = RT0402BRD07137KL: RES SMD 137K OHM 0.1% 1/16W 0402; Manufacturer: Yageo; Item Type: Resistors; Value: 137kR; Max Power Dissipation: 63mW; Temperature Coefficient: 25ppm/°C; Voltage Rating: 50V; Supplier: Digikey; LCSC Part Number: C852519; Manufacturer Part Number: RT0402BRD07137KL; RoHS: Yes; Stock: 18830; Pricing: 1=0.2, 10=0.15, 50=0.1174, 100=0.1051, 500=0.07972, 1000=0.07035, 5000=0.05199 (USD); Case/Package: 0402; Min Operating Temperature: -55°C; Max Operating Temperature: 155°C; Packaging: Tape and Reel; Number of Terminations: 2; Tolerance: 0.1%; Features: Moisture Resistant; Series: RT; Length: 0.039inch; Width: 0.02inch; Height: 0.014inch; ComponentLink1URL: http://www.yageo.com/documents/recent/PYu-RT_1-to-0.01_RoHS_L_8.pdf?src-supplier=Digikey; ComponentLink1Description: http://www.yageo.com/documents/recent/PYu-RT_1-to-0.01_RoHS_L_8.pdf?src-supplier=Digikey
R9 = RT0402BRD07100KL: RES SMD 100K OHM 0.1% 1/16W 0402; Manufacturer: Yageo; Voltage Rating (DC): 50V; Item Type: Resistor; Supplier: Digikey; Supplier Part Number: YAG1343CT-ND; Manufacturer Part Number: RT0402BRD07100KL; RoHS: Yes; Category: Chip SMD Resistors; Stock: 62932; Pricing: 1=0.16, 10=0.121, 50=0.0958, 100=0.0859, 500=0.0654, 1000=0.0578, 5000=0.04283 (USD); ComponentLink1URL: https://datasheet.ciiva.com/12724/pyu-rt-1-to-0-05-rohs-l-4-12724954.pdf?src-supplier=Mouser; ComponentLink1Description: https://datasheet.ciiva.com/12724/pyu-rt-1-to-0-05-rohs-l-4-12724954.pdf?src-supplier=Mouser; LCSC Part Number: C852472
R10 = CRCW04025K23FKED: RES SMD 5.23K OHM 1% 1/16W 0402; Manufacturer: Vishay; Item Type: Resistors; Value: 5.23kR; Power Rating: 63mW; Temperature Coefficient: 100ppm/°C; Voltage Rating: 50V; Supplier: Avnet; LCSC Part Number: C2076550; Manufacturer Part Number: CRCW04025K23FKED; RoHS: Yes; Stock: 10000; Pricing: 20000=0.00245 (USD); Case/Package: 0402; Pins: 2; Contact Plating: Tin; Weight: 2.3E-05oz; Case Code (Imperial): 0402; Case Code (Metric): 1005; Min Operating Temperature: -55°C; Max Operating Temperature: 155°C; Tolerance: 1%; Packaging: Tape and Reel; Package Quantity: 10; Termination: SMD/SMT; Number of Terminations: 2; Max Power Dissipation: 63mW; Features: Automotive AEC-Q200; Series: CRCW; Resistor Type: Thick Film; Working Voltage: 50V; Resistance Tolerance: 1%; Technology: THICK FILM; Voltage Rating (DC): 50V; Length: 1mm; Width: 0.02inch; Height: 0.35mm; Depth: 0.5mm; Radiation Hardening: No; RoHS Compliant: Yes; Lead Free: 5697LeadFree; Reach SVHC Compliant: Unknown; ComponentLink1URL: https://datasheet.ciiva.com/7679/1697337-7679068.pdf?src-supplier=Element14; ComponentLink1Description: https://datasheet.ciiva.com/7679/1697337-7679068.pdf?src-supplier=Element14; ComponentLink2URL: https://datasheet.ciiva.com/22702/1697337-22702815.pdf?src-supplier=Element14; ComponentLink2Description: https://datasheet.ciiva.com/22702/1697337-22702815.pdf?src-supplier=Element14; ComponentLink3URL: https://datasheet.ciiva.com/2463/dcrcwe3-2463422.pdf?src-supplier=Digikey; ComponentLink3Description: https://datasheet.ciiva.com/2463/dcrcwe3-2463422.pdf?src-supplier=Digikey; ComponentLink4URL: https://datasheet.ciiva.com/6051/125364-6051350.pdf?src-supplier=Farnell; ComponentLink4Description: https://datasheet.ciiva.com/6051/125364-6051350.pdf?src-supplier=Farnell; ComponentLink5URL: https://datasheet.ciiva.com/7743/125364-7743706.pdf?src-supplier=Element14; ComponentLink5Description: https://datasheet.ciiva.com/7743/125364-7743706.pdf?src-supplier=Element14; ComponentLink6URL: https://datasheet.ciiva.com/7679/1697337-7679069.pdf?src-supplier=Element14; ComponentLink6Description: https://datasheet.ciiva.com/7679/1697337-7679069.pdf?src-supplier=Element14; ComponentLink7URL: https://datasheet.ciiva.com/2463/dcrcwe3-2463423.pdf?src-supplier=Digikey; ComponentLink7Description: https://datasheet.ciiva.com/2463/dcrcwe3-2463423.pdf?src-supplier=Digikey; ComponentLink8URL: https://datasheet.ciiva.com/2463/dcrcwe3-2463421.pdf?src-supplier=Digikey; ComponentLink8Description: https://datasheet.ciiva.com/2463/dcrcwe3-2463421.pdf?src-supplier=Digikey; ComponentLink9URL: https://datasheet.ciiva.com/16767/70201119-16767021.pdf?src-supplier=Allied+Electronics; ComponentLink9Description: https://datasheet.ciiva.com/16767/70201119-16767021.pdf?src-supplier=Allied+Electronics; ComponentLink10URL: https://datasheet.ciiva.com/22869/70201119-22869546.pdf?src-supplier=Allied+Electronics; ComponentLink10Description: https://datasheet.ciiva.com/22869/70201119-22869546.pdf?src-supplier=Allied+Electronics; ComponentLink11URL: https://datasheet.ciiva.com/3256/dcrcwe3-3256686.pdf?src-supplier=Avnet; ComponentLink11Description: https://datasheet.ciiva.com/3256/dcrcwe3-3256686.pdf?src-supplier=Avnet; ComponentLink12URL: https://datasheet.ciiva.com/16200/dcrcwe3-16200567.pdf?src-supplier=Future+Electronics; ComponentLink12Description: https://datasheet.ciiva.com/16200/dcrcwe3-16200567.pdf?src-supplier=Future+Electronics
R11 = RT0402BRD0730K1L: RES SMD 30.1KOHM 0.1% 1/16W 0402; Manufacturer: Yageo; Item Type: Resistor; Supplier: Rs; Supplier Part Number: 1991324P; Manufacturer Part Number: RT0402BRD0730K1L; RoHS: Yes; Category: Chip SMD Resistors; Stock: 7420; Pricing: 100=0.138, 250=0.115, 500=0.092, 1000=0.076 (GBP); ComponentLink1URL: https://datasheet.ciiva.com/12722/pyu-rt-1-to-0-05-rohs-l-4-12722119.pdf?src-supplier=Mouser; ComponentLink1Description: https://datasheet.ciiva.com/12722/pyu-rt-1-to-0-05-rohs-l-4-12722119.pdf?src-supplier=Mouser; ComponentLink2URL: https://datasheet.ciiva.com/2582/pyu-rt-1-to-0-05-rohs-l-5-2582303.pdf?src-supplier=Digi-Key; ComponentLink2Description: https://datasheet.ciiva.com/2582/pyu-rt-1-to-0-05-rohs-l-5-2582303.pdf?src-supplier=Digi-Key; LCSC Part Number: C852714
R27 = RC0201FR-071KL: RES 1K OHM 1% 1/20W 0201; Manufacturer: Yageo; Value: 1kR; Temperature Coefficient: 200ppm/°C; Power Rating: 50mW; Voltage Rating: 25V; Item Type: Resistor; Supplier: Digi-Key; Supplier Part Number: 311-1KMCT-ND; Manufacturer Part Number: RC0201FR-071KL; RoHS: Yes; Category: Chip SMD Resistors; Stock: 5606340; Pricing: 1=0.1, 10=0.027, 50=0.0172, 100=0.0143, 500=0.00988, 1000=0.00854, 5000=0.00629 (USD); Case/Package: 0201; Contact Plating: Tin,Matte; Case Code (Metric): 0603; Case Code (Imperial): 0201; Min Operating Temperature: -55°C; Max Operating Temperature: 125°C; Tolerance: 1%; Resistor Type: Thick Film; Package Quantity: 10000; Packaging: Tape and Reel; Number of Terminations: 2; Termination: SMD/SMT; Max Power Dissipation: 50mW; Working Voltage: 25V; Features: Moisture Resistant; Series: RC; Resistance Tolerance: 1%; Technology: THICK FILM; Construction: Rectangular; Voltage Rating (DC): 25V; Length: 0.024inch; Width: 0.012inch; Height: 0.01inch; Depth: 0.3mm; Military Standard: Not; RoHS Compliant: Yes; Reach SVHC Compliant: Unknown; Lead Free: 5697LeadFree; ComponentLink1URL: https://datasheet.ciiva.com/7672/1563626-7672204.pdf?src-supplier=Element14; ComponentLink1Description: https://datasheet.ciiva.com/7672/1563626-7672204.pdf?src-supplier=Element14; ComponentLink2URL: https://datasheet.ciiva.com/22698/1563626-22698505.pdf?src-supplier=Element14; ComponentLink2Description: https://datasheet.ciiva.com/22698/1563626-22698505.pdf?src-supplier=Element14; ComponentLink3URL: https://datasheet.ciiva.com/29721/pyu-r-int-thick-7-29721196.pdf?src-supplier=Digi-Key; ComponentLink3Description: https://datasheet.ciiva.com/29721/pyu-r-int-thick-7-29721196.pdf?src-supplier=Digi-Key; ComponentLink4URL: https://datasheet.ciiva.com/29721/pyu-r-int-thick-7-29721195.pdf?src-supplier=Digi-Key; ComponentLink4Description: https://datasheet.ciiva.com/29721/pyu-r-int-thick-7-29721195.pdf?src-supplier=Digi-Key; ComponentLink5URL: https://datasheet.ciiva.com/8896/pyu-rc0201-51-rohs-l-8-8896174.pdf?src-supplier=Avnet; ComponentLink5Description: https://datasheet.ciiva.com/8896/pyu-rc0201-51-rohs-l-8-8896174.pdf?src-supplier=Avnet; LCSC Part Number: C138165
TP1 TP2 = TEST POINT 0.5mm Dia: Test Point ON; Item Type: Test Point; Manufacturer Part Number: TEST POINT 0.5mm Dia
TP3 = 2 Test Pad: Wire Connecting Pad; Item Type: Test Point; Manufacturer Part Number: 2 Test Pad
U1 = BQ25792RQMR: Charger IC Lithium Ion/Polymer 29-VQFN-HR (4x4); Manufacturer: Texas Instruments; Supplier: Mouser; Supplier Part Number: 595-BQ25792RQMR; Manufacturer Part Number: BQ25792RQMR; RoHS: Yes; Item Type: IC; Stock: 3694; Pricing: 1=6.03, 10=4.63, 50=4.28, 100=3.89, 1000=3.49, 10000=3.38 (USD)
U2 = LD56100DPU33R: IC REG LINEAR 3.3V 1A 8DFN; Manufacturer: STMicroelectronics; Output Type: Fixed; Output Configuration: Positive; Number of Regulators: 1; Max Supply Voltage: 5.5V; Quiescent Current: 155uA; Power Supply Rejection Ratio (PSRR): 55dB; Supplier: Mouser; LCSC Part Number: C2969937; Manufacturer Part Number: LD56100DPU33R; RoHS: Yes; Item Type: IC; Pricing: 1=1.23, 10=0.751, 50=0.751, 100=0.479, 1000=0.326, 10000=0.229 (USD); Mounting Technology: Surface Mount; Case/Package: DFN; Min Operating Temperature: -40°C; Max Operating Temperature: 85°C; Packaging: Cut Tape; Min Output Voltage: 3.3V; Output Current: 1A; Series: -; RoHS Compliant: Yes; ComponentLink1URL: https://www.st.com/resource/en/datasheet/ld56100.pdf?src-supplier=Digikey; ComponentLink1Description: https://www.st.com/resource/en/datasheet/ld56100.pdf?src-supplier=Digikey
U8 = TPS61222DCKR: IC REG BOOST 5V 200MA SC70-6; Manufacturer: Texas Instruments; Supplier: Mouser; LCSC Part Number: C116461; Manufacturer Part Number: TPS61222DCKR; RoHS: Yes; Item Type: IC; Stock: 20831; Pricing: 1=1.08, 10=0.78, 50=0.705, 100=0.622, 1000=0.515, 10000=0.476 (USD); ComponentLink1URL: https://datasheet.ciiva.com/2034/tps61220-2034085.pdf?src-supplier=Digikey; ComponentLink1Description: https://datasheet.ciiva.com/2034/tps61220-2034085.pdf?src-supplier=Digikey; ComponentLink2URL: https://datasheet.ciiva.com/14376/tps61222-14376997.pdf?src-supplier=Avnet; ComponentLink2Description: https://datasheet.ciiva.com/14376/tps61222-14376997.pdf?src-supplier=Avnet
U9 = XB8886A: SOIC-8-EP Battery Management ICs ROHS; Manufacturer: XySemi; Item Type: IC; Manufacturer Part Number: XB8886A; Package: SOIC-8-EP; LCSC Part Number: C669690; ComponentLink1Description: LCSC; ComponentLink1URL: https://www.lcsc.com/product-detail/Battery-Management-ICs_XySemi-XB8886A_C669690.html